# Altium schematic sheet Top-Sheet.SchDoc
size A4; SheetNumber: 1; SheetTotal: 8
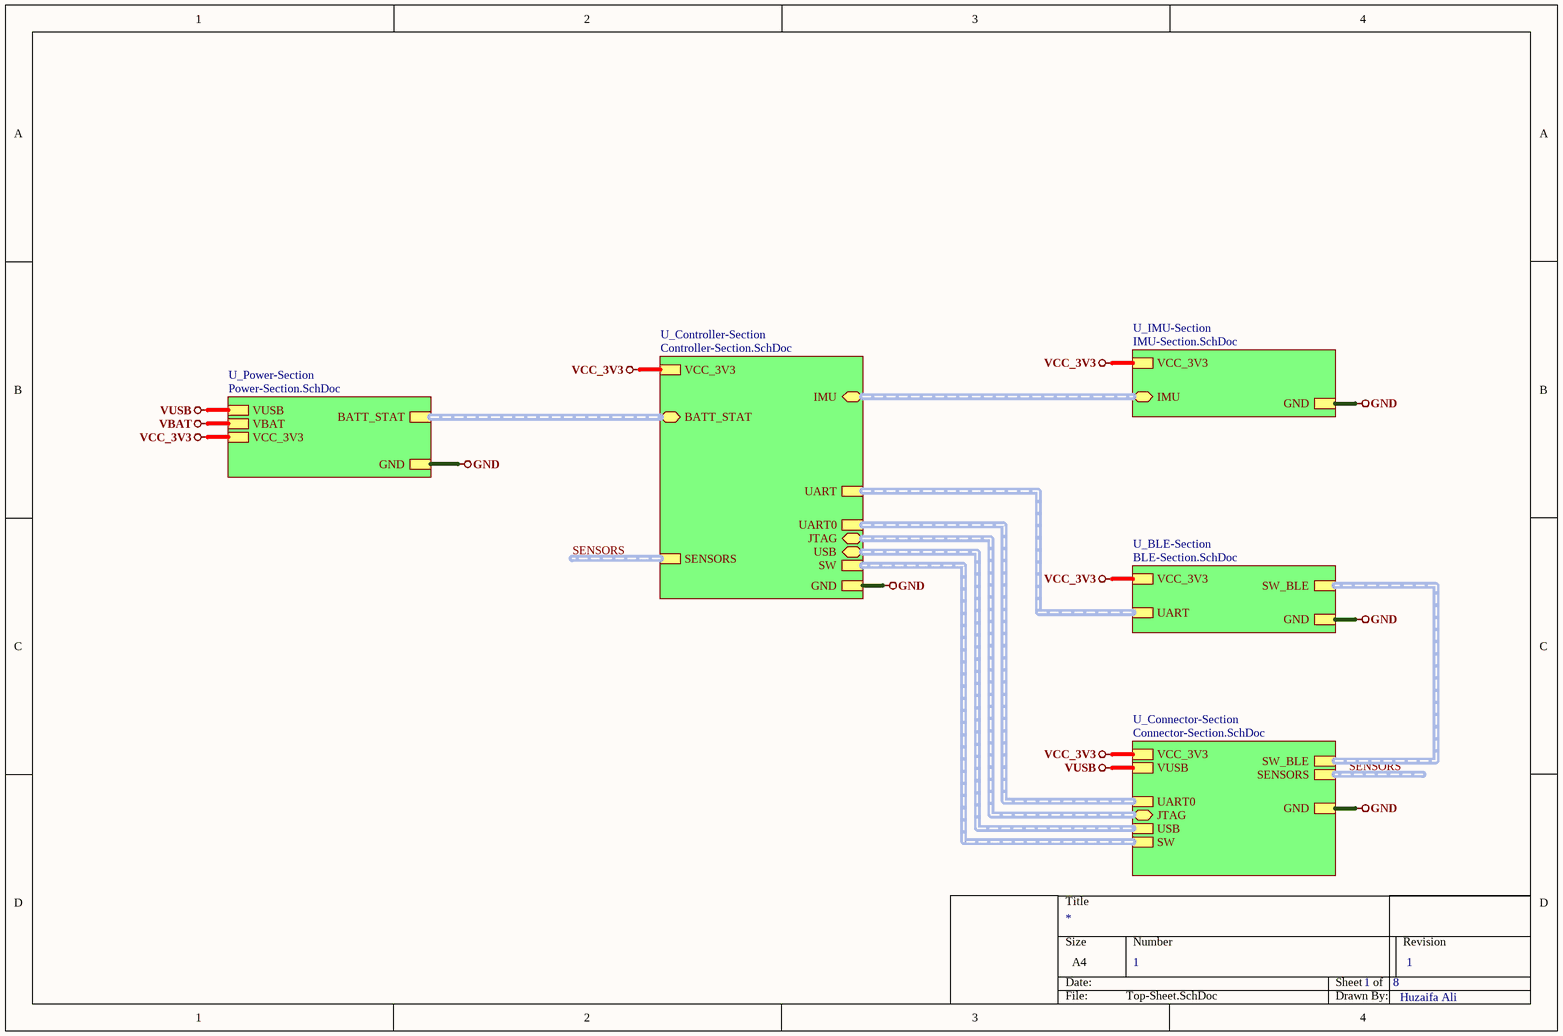
[diagram p0: Top-Sheet.SchDoc]

## Sub-sheets
U_BLE-Section = BLE-Section.SchDoc: UART (harness UART), SW_BLE (harness SW_BLE), VCC_3V3, GND
U_Connector-Section = Connector-Section.SchDoc: SW_BLE (harness SW_BLE), USB (harness USB), VCC_3V3, GND, VUSB, JTAG (bidir, harness JTAG), SENSORS (harness SENSORS), SW (harness SW), UART0 (harness UART)
U_Controller-Section = Controller-Section.SchDoc: BATT_STAT (bidir, harness BATT_STAT), IMU (bidir, harness IMU), USB (bidir, harness USB), VCC_3V3, GND, UART (harness UART), JTAG (bidir, harness JTAG), SENSORS (harness SENSORS), SW (harness SW), UART0 (harness UART)
U_IMU-Section = IMU-Section.SchDoc: IMU (bidir, harness IMU), VCC_3V3, GND
U_Power-Section = Power-Section.SchDoc: VUSB, GND, VBAT, VCC_3V3, BATT_STAT (harness BATT_STAT)

## Nets
GND: sheet U_Power-Section/GND, sheet U_Controller-Section/GND, sheet U_IMU-Section/GND, sheet U_BLE-Section/GND, sheet U_Connector-Section/GND
VBAT: sheet U_Power-Section/VBAT
VCC_3V3: sheet U_Power-Section/VCC_3V3, sheet U_Controller-Section/VCC_3V3, sheet U_IMU-Section/VCC_3V3, sheet U_BLE-Section/VCC_3V3, sheet U_Connector-Section/VCC_3V3
VUSB: sheet U_Power-Section/VUSB, sheet U_Connector-Section/VUSB

## Buses and harness runs
harness SENSORS = sheet U_Connector-Section/SENSORS
harness SENSORS = sheet U_Controller-Section/SENSORS
harness sheet U_BLE-Section/SW_BLE = sheet U_Connector-Section/SW_BLE
harness sheet U_BLE-Section/UART = sheet U_Controller-Section/UART
harness sheet U_Connector-Section/JTAG = sheet U_Controller-Section/JTAG
harness sheet U_Connector-Section/SW = sheet U_Controller-Section/SW
harness sheet U_Connector-Section/UART0 = sheet U_Controller-Section/UART0
harness sheet U_Connector-Section/USB = sheet U_Controller-Section/USB
harness sheet U_Controller-Section/BATT_STAT = sheet U_Power-Section/BATT_STAT
harness sheet U_Controller-Section/IMU = sheet U_IMU-Section/IMU

## Notes on the sheet
- 1
- Huzaifa Ali